# EasyEDA Pro project bliysfyt-night-light-af2cf507.epro, schematic Schematic1

## Sheets
1 P1: Create Date: 2024-02-15; Page Name: P1; Project Name: 夜灯; Schematic Name: Schematic1; Update Date: 2024-02-20; Page Size: A4; Version: V1.0
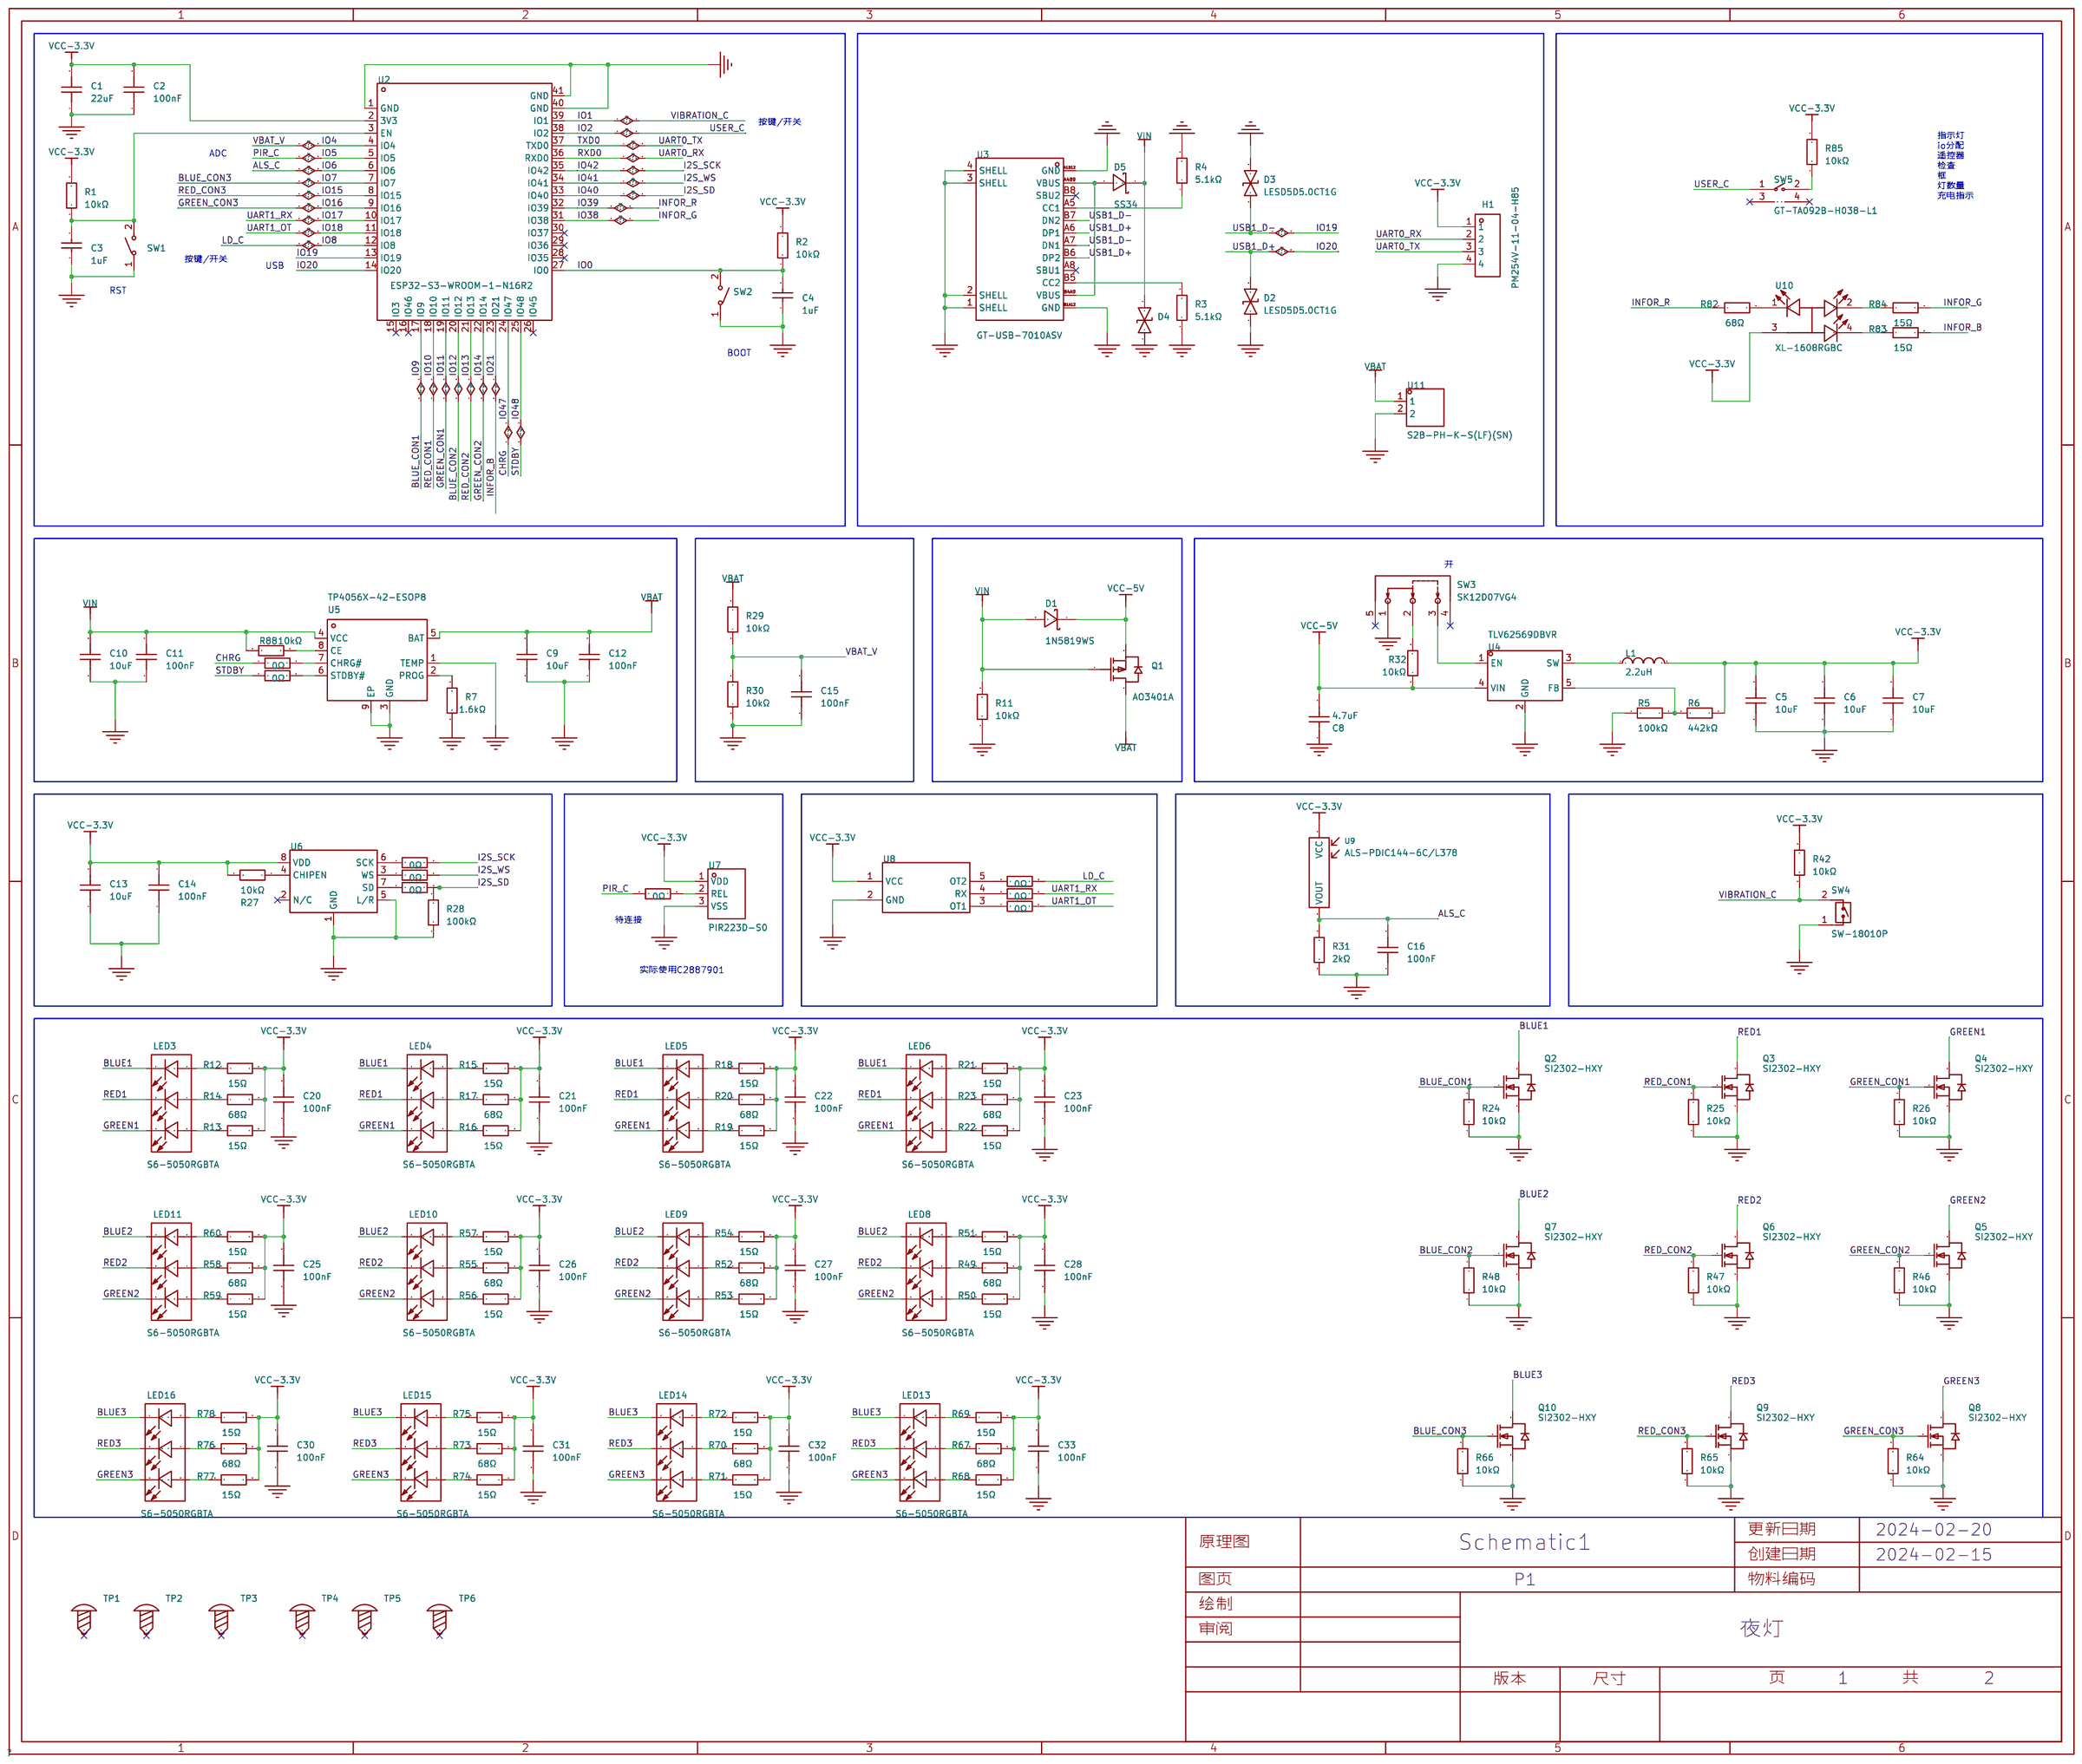
[diagram p0: P1]
2 P2: Create Date: 2024-02-18; Page Name: P2; Update Date: 2024-02-18; Company: 嘉立创EDA
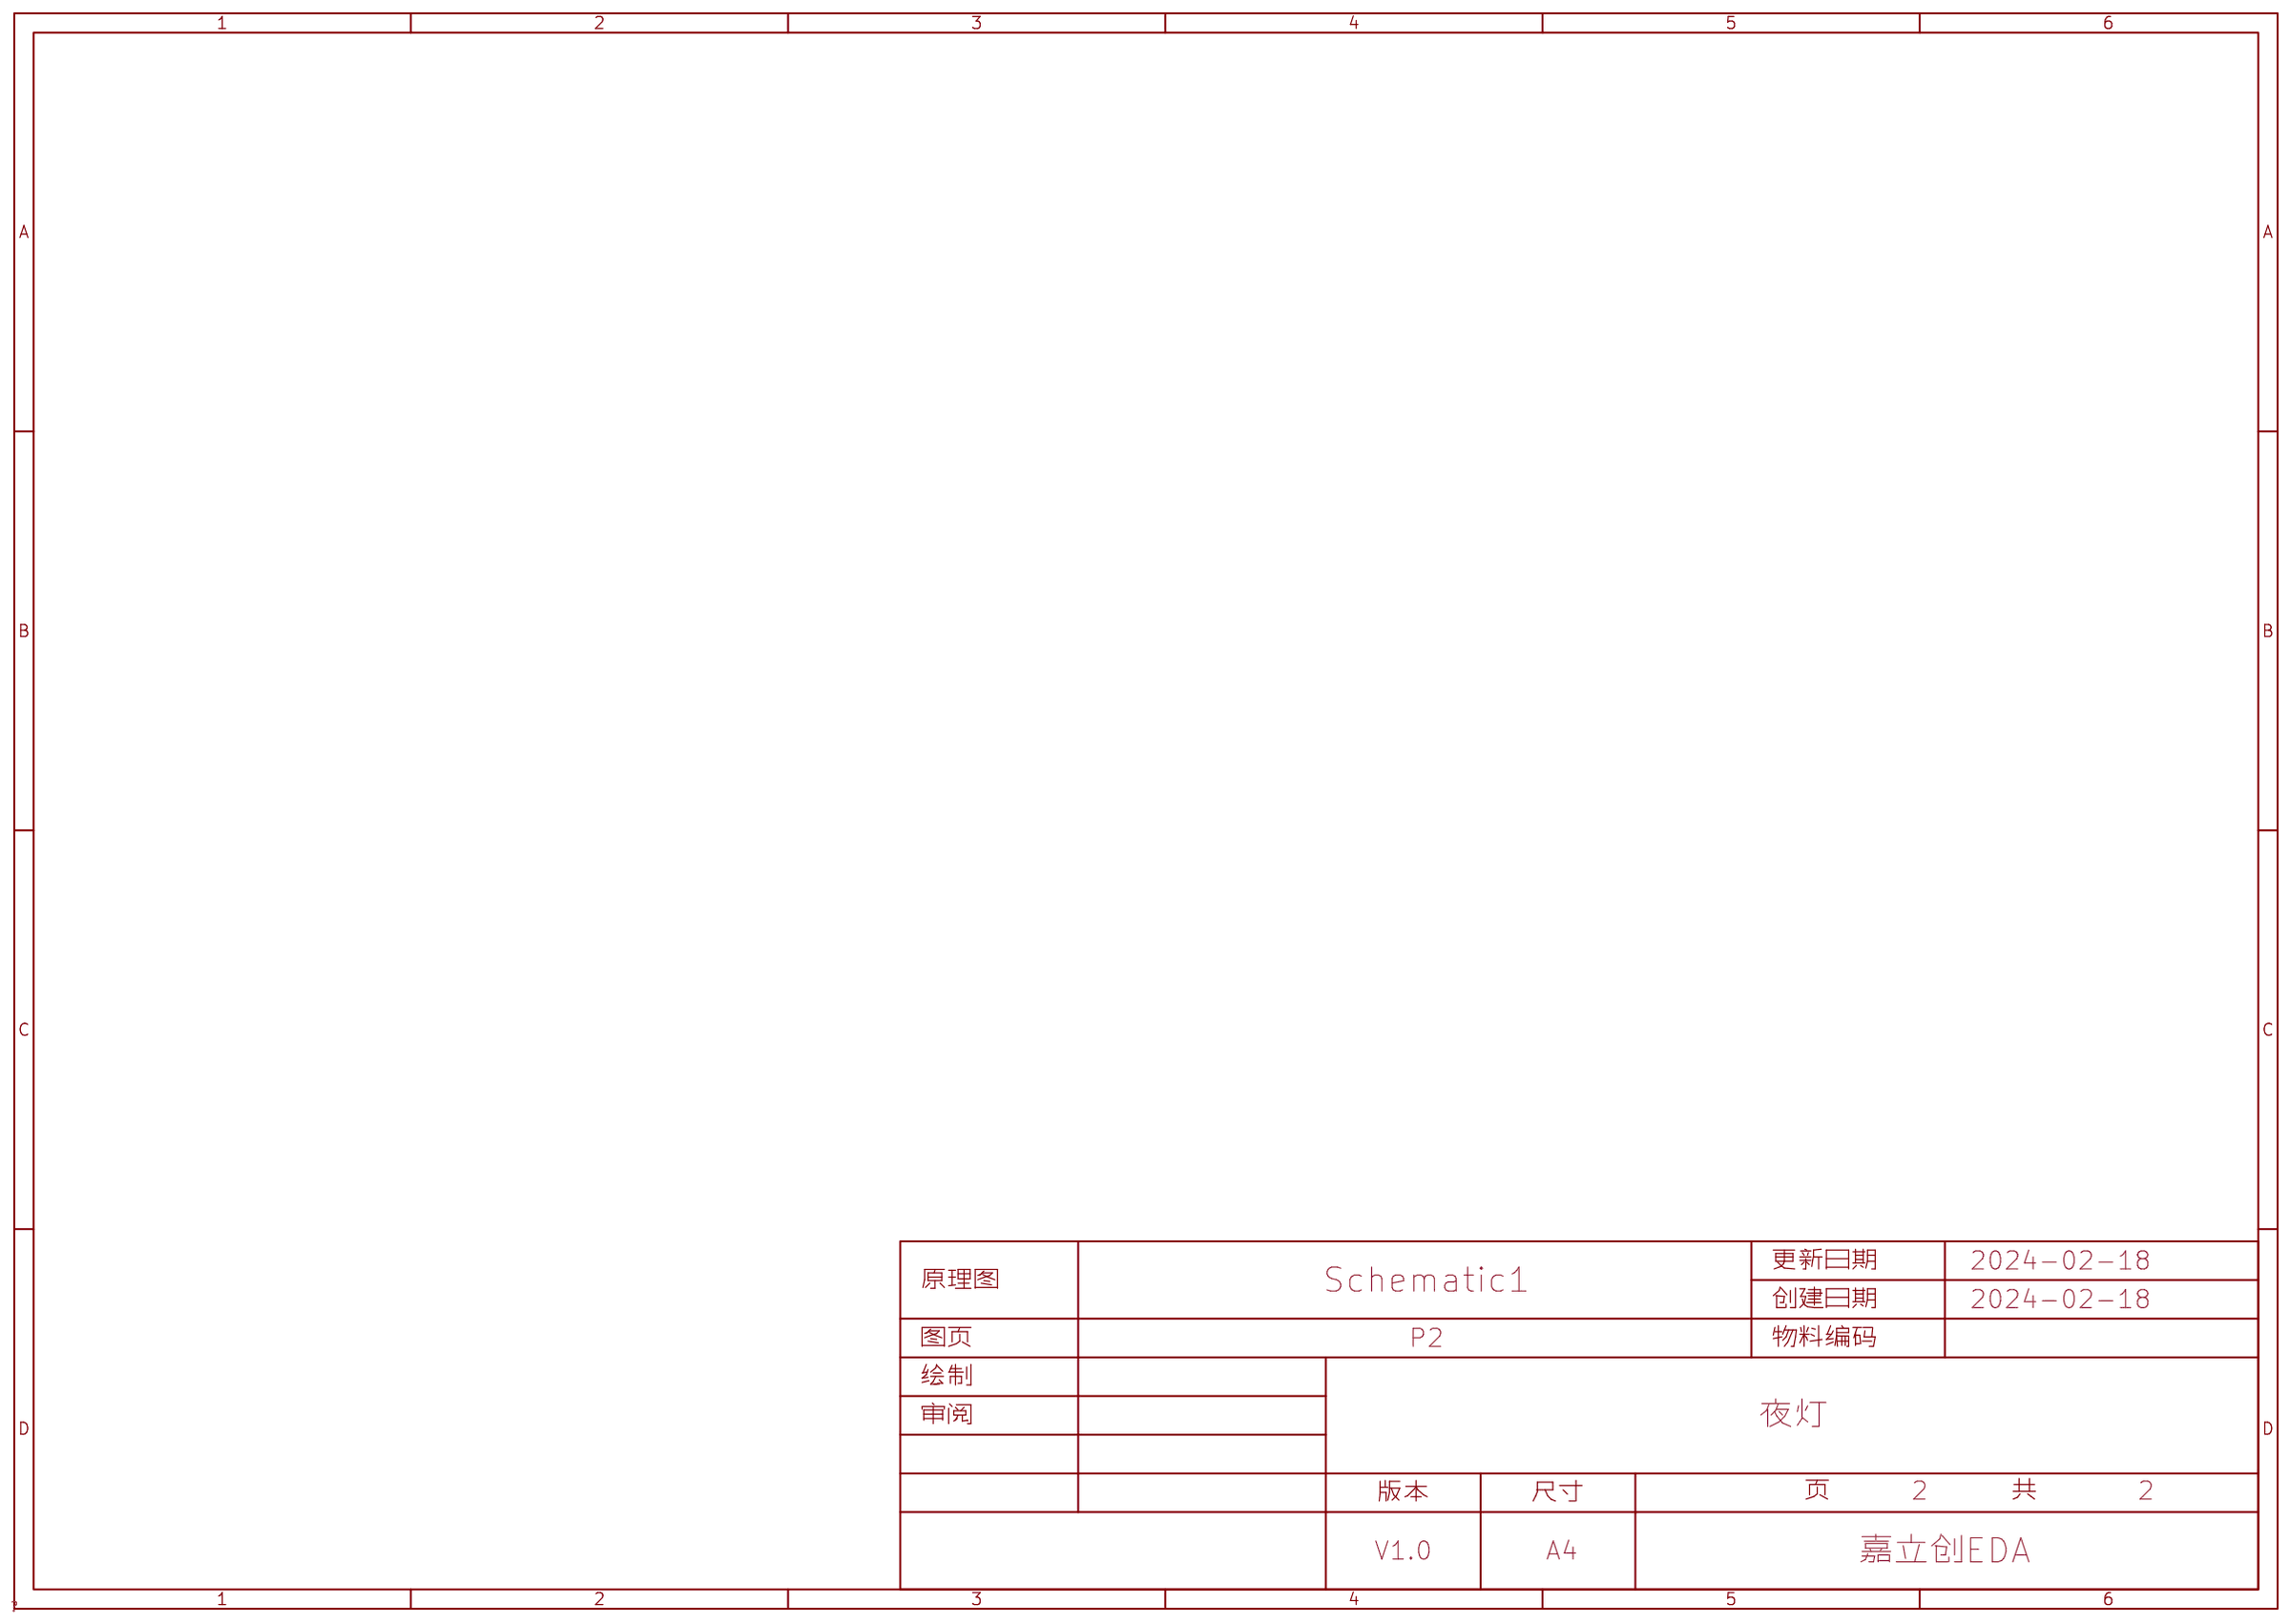
[diagram p1: P2]

## Parts
C1  22uF  [C0603]
C2  100nF  [C0603]
C3  1uF  [C0603]
C4  1uF  [C0603]
C5  10uF  [C0603]
C6  10uF  [C0603]
C7  10uF  [C0603]
C8  4.7uF  [C0603]
C9  10uF  [C0603]
C10  10uF  [C0603]
C11  100nF  [C0603]
C12  100nF  [C0603]
C13  10uF  [C0603]
C14  100nF  [C0603]
C15  100nF  [C0603]
C16  100nF  [C0603]
C20  100nF  [C0603]
C21  100nF  [C0603]
C22  100nF  [C0603]
C23  100nF  [C0603]
C25  100nF  [C0603]
C26  100nF  [C0603]
C27  100nF  [C0603]
C28  100nF  [C0603]
C30  100nF  [C0603]
C31  100nF  [C0603]
C32  100nF  [C0603]
C33  100nF  [C0603]
D1  1N5819WS  [SOD-323_L1.8-W1.3-LS2.5-RD]
D2  LESD5D5.0CT1G  [SOD-523_L1.2-W0.8-LS1.6-BI]
D3  LESD5D5.0CT1G  [SOD-523_L1.2-W0.8-LS1.6-BI]
D4  LESD5D5.0CT1G  [SOD-523_L1.2-W0.8-LS1.6-BI]
D5  SS34  [SMA_L4.3-W2.6-LS5.2-RD]
H1  PM254V-11-04-H85  [HDR-TH_4P-P2.54-V-F]
L1  2.2uH  [IND-SMD_L4.4-W4.2]
LED3  S6-5050RGBTA  [LED-SMD_6P-L5.0-W5.0-P1.60-LS5.4-TL]
LED4  S6-5050RGBTA  [LED-SMD_6P-L5.0-W5.0-P1.60-LS5.4-TL]
LED5  S6-5050RGBTA  [LED-SMD_6P-L5.0-W5.0-P1.60-LS5.4-TL]
LED6  S6-5050RGBTA  [LED-SMD_6P-L5.0-W5.0-P1.60-LS5.4-TL]
LED8  S6-5050RGBTA  [LED-SMD_6P-L5.0-W5.0-P1.60-LS5.4-TL]
LED9  S6-5050RGBTA  [LED-SMD_6P-L5.0-W5.0-P1.60-LS5.4-TL]
LED10  S6-5050RGBTA  [LED-SMD_6P-L5.0-W5.0-P1.60-LS5.4-TL]
LED11  S6-5050RGBTA  [LED-SMD_6P-L5.0-W5.0-P1.60-LS5.4-TL]
LED13  S6-5050RGBTA  [LED-SMD_6P-L5.0-W5.0-P1.60-LS5.4-TL]
LED14  S6-5050RGBTA  [LED-SMD_6P-L5.0-W5.0-P1.60-LS5.4-TL]
LED15  S6-5050RGBTA  [LED-SMD_6P-L5.0-W5.0-P1.60-LS5.4-TL]
LED16  S6-5050RGBTA  [LED-SMD_6P-L5.0-W5.0-P1.60-LS5.4-TL]
Q1  AO3401A  [SOT-23_L2.9-W1.3-P1.90-LS2.4-BR]
Q2  SI2302-HXY  [SOT-23-3_L2.9-W1.3-P1.90-LS2.4-BR]
Q3  SI2302-HXY  [SOT-23-3_L2.9-W1.3-P1.90-LS2.4-BR]
Q4  SI2302-HXY  [SOT-23-3_L2.9-W1.3-P1.90-LS2.4-BR]
Q5  SI2302-HXY  [SOT-23-3_L2.9-W1.3-P1.90-LS2.4-BR]
Q6  SI2302-HXY  [SOT-23-3_L2.9-W1.3-P1.90-LS2.4-BR]
Q7  SI2302-HXY  [SOT-23-3_L2.9-W1.3-P1.90-LS2.4-BR]
Q8  SI2302-HXY  [SOT-23-3_L2.9-W1.3-P1.90-LS2.4-BR]
Q9  SI2302-HXY  [SOT-23-3_L2.9-W1.3-P1.90-LS2.4-BR]
Q10  SI2302-HXY  [SOT-23-3_L2.9-W1.3-P1.90-LS2.4-BR]
R1  10kΩ  [R0603]
R2  10kΩ  [R0603]
R3  5.1kΩ  [R0603]
R4  5.1kΩ  [R0603]
R5  100kΩ  [R0603]
R6  442kΩ  [R0603]
R7  1.6kΩ  [R0603]
R11  10kΩ  [R0603]
R12  15Ω  [R0603]
R13  15Ω  [R0603]
R14  68Ω  [R0603]
R15  15Ω  [R0603]
R16  15Ω  [R0603]
R17  68Ω  [R0603]
R18  15Ω  [R0603]
R19  15Ω  [R0603]
R20  68Ω  [R0603]
R21  15Ω  [R0603]
R22  15Ω  [R0603]
R23  68Ω  [R0603]
R24  10kΩ  [R0603]
R25  10kΩ  [R0603]
R26  10kΩ  [R0603]
R27  10kΩ  [R0603]
R28  100kΩ  [R0603]
R29  10kΩ  [R0603]
R30  10kΩ  [R0603]
R31  2kΩ  [R0603]
R32  10kΩ  [R0603]
R35  0Ω  [R0603]
R36  0Ω  [R0603]
R37  0Ω  [R0603]
R38  0Ω  [R0603]
R39  0Ω  [R0603]
R40  0Ω  [R0603]
R41  0Ω  [R0603]
R42  10kΩ  [R0603]
R46  10kΩ  [R0603]
R47  10kΩ  [R0603]
R48  10kΩ  [R0603]
R49  68Ω  [R0603]
R50  15Ω  [R0603]
R51  15Ω  [R0603]
R52  68Ω  [R0603]
R53  15Ω  [R0603]
R54  15Ω  [R0603]
R55  68Ω  [R0603]
R56  15Ω  [R0603]
R57  15Ω  [R0603]
R58  68Ω  [R0603]
R59  15Ω  [R0603]
R60  15Ω  [R0603]
R64  10kΩ  [R0603]
R65  10kΩ  [R0603]
R66  10kΩ  [R0603]
R67  68Ω  [R0603]
R68  15Ω  [R0603]
R69  15Ω  [R0603]
R70  68Ω  [R0603]
R71  15Ω  [R0603]
R72  15Ω  [R0603]
R73  68Ω  [R0603]
R74  15Ω  [R0603]
R75  15Ω  [R0603]
R76  68Ω  [R0603]
R77  15Ω  [R0603]
R78  15Ω  [R0603]
R82  68Ω  [R0603]
R83  15Ω  [R0603]
R84  15Ω  [R0603]
R85  10kΩ  [R0603]
R86  0Ω  [R0603]
R87  0Ω  [R0603]
R88  10kΩ  [R0603]
SW1  TS-1088R-02026  [SW-SMD_L3.9-W3.0-P4.45]
SW2  TS-1088R-02026  [SW-SMD_L3.9-W3.0-P4.45]
SW3  SK12D07VG4  [SW-TH_SK12D07VG4]
SW4  SW-18010P  [SW-TH_SW-18010P]
SW5  GT-TA092B-H038-L1  [SW-TH_GT-TA092B-H038-L1]
TP1  -  [M3螺丝]
TP2  -  [M3螺丝]
TP3  -  [M3螺丝]
TP4  -  [M3螺丝]
TP5  -  [M3螺丝]
TP6  -  [M3螺丝]
U2  ESP32-S3-WROOM-1-N16R2  [WIRELM-SMD_ESP32-S3-WROOM-1]
U3  GT-USB-7010ASV  [USB-C-SMD_G-SWITCH_GT-USB-7010ASV]
U4  TLV62569DBVR  [SOT-23-5_L3.0-W1.7-P0.95-LS2.8-BR]
U5  TP4056X-42-ESOP8  [SOP-8_L4.9-W3.9-P1.27-LS6.0-TL-EP]
U6  MSM261S4030H0R  [LGA-8_L4.0-W3.0-P1.00-BL]
U7  PIR223D-S0  [TO-5-3_BD9.1-P2.54-L]
U8  -  [HLK-LD2410S/2420封装]
U9  ALS-PDIC144-6C/L378  [SENSORM-TH_EVERLIGHT_ALS-PDIC144-6C--L378]
U10  XL-1608RGBC  [LED-SMD_4P-L1.6-W0.8-BL]
U11  S2B-PH-K-S(LF)(SN)  [CONN-TH_S2B-PH-K-S-LF-SN]

## Library data of the parts
C1 = CL10A226MQ8NRNC: 容值:22uF;精度:±20%;额定电压:6.3V;材质(温度系数):X5R;; LCSC Part Name: 22uF ±20% 6.3V; Supplier Part: C59461; Manufacturer: SAMSUNG(三星); Supplier Footprint: 0603; JLCPCB Part Class: 基础库; Datasheet: https://atta.szlcsc.com/upload/public/pdf/source/20160218/1457707763339.pdf; Supplier: LCSC; Tolerance: ±20%; Voltage Rated: 6.3V; Temperature Coefficient: X5R
C2 C11 C12 C14-C16 C20-C23 C25-C28 C30-C33 = CC0603KRX7R9BB104: 容值:100nF;精度:±10%;额定电压:50V;材质(温度系数):X7R;; LCSC Part Name: 100nF ±10% 50V; Supplier Part: C14663; Manufacturer: YAGEO(国巨); Supplier Footprint: 0603; JLCPCB Part Class: 基础库; Datasheet: https://atta.szlcsc.com/upload/public/pdf/source/20180910/C282072_33301C7F631E79921B82A8DAC6BCC5B3.pdf; Supplier: LCSC; Tolerance: ±10%; Voltage Rated: 50V; Temperature Coefficient: X7R
C3 C4 = CL10A105KB8NNNC: 容值:1uF;精度:±10%;额定电压:50V;材质(温度系数):X5R;; LCSC Part Name: 1uF ±10% 50V; Supplier Part: C15849; Manufacturer: SAMSUNG(三星); Supplier Footprint: 0603; JLCPCB Part Class: Basic Part; Datasheet: https://atta.szlcsc.com/upload/public/pdf/source/20160218/1457707763339.pdf; Supplier: LCSC; Tolerance: ±10%; Voltage Rated: 50V; Temperature Coefficient: X5R
C5-C7 C9 C10 C13 = CL10A106KP8NNNC: 容值:10uF;精度:±10%;额定电压:10V;材质(温度系数):X5R;; LCSC Part Name: 10uF ±10% 10V; Supplier Part: C19702; Manufacturer: SAMSUNG(三星); Supplier Footprint: 0603; JLCPCB Part Class: 基础库; Datasheet: https://atta.szlcsc.com/upload/public/pdf/source/20160218/1457707763339.pdf; Supplier: LCSC; Tolerance: ±10%; Voltage Rated: 10V; Temperature Coefficient: X5R
C8 = GRM188Z71C475KE21D: 容值:4.7uF;精度:±10%;额定电压:16V;材质(温度系数):X7R;; LCSC Part Name: 4.7uF ±10% 16V; Supplier Part: C389010; Manufacturer: muRata(村田); Supplier Footprint: 0603; JLCPCB Part Class: 扩展库; Datasheet: https://atta.szlcsc.com/upload/public/pdf/source/20190418/C389010_378994D96815F6C3A9D8A85630794D48.pdf; Supplier: LCSC; Tolerance: ±10%; Voltage Rated: 16V; Temperature Coefficient: X7R
D1 = 1N5819WS_C191023: 正向压降(Vf):600mV@1A;直流反向耐压(Vr):40V;平均整流电流(Io):1A;; LCSC Part Name: 电压:40V 电流:1A; Supplier Part: C191023; Manufacturer: Hottech(合科泰); Supplier Footprint: SOD-323; JLCPCB Part Class: 基础库; Datasheet: https://atta.szlcsc.com/upload/public/pdf/source/20220428/3CB86FD8D28D653594B4E35F9D5AEFD9.pdf; Supplier: LCSC; Forward Voltage (Vf@If): 600mV@1A; Reverse Voltage (Vr): 40V; Average Rectified Current (Io): 1A
D2-D4 = LESD5D5.0CT1G: 极性:双向;反向截止电压(Vrwm):5V;最大钳位电压:18.6V;峰值脉冲电流(Ipp)@10/1000us:9.4A;击穿电压:5.6V;; LCSC Part Name: 双向ESD; Supplier Part: C383211; Manufacturer: LRC(乐山无线电); Supplier Footprint: SOD-523; JLCPCB Part Class: 扩展库; Datasheet: https://atta.szlcsc.com/upload/public/pdf/source/20190807/C383211_633DF4B4E2C161403226E5235FE33A1C.pdf; Supplier: LCSC; polarity: 双向; Reverse Stand-Off Voltage (Vrwm): 5V; Maximum Clamping Voltage: 18.6V; Peak Pulse Current (Ipp)@10/1000us: 9.4A; Breakdown Voltage: 5.6V; Type: ESD
D5 = SS34_C8678: 二极管配置:独立式;正向压降(Vf):550mV@3A;直流反向耐压(Vr):40V;平均整流电流(Io):3A;; LCSC Part Name: 电压:40V 电流:3A; Supplier Part: C8678; Manufacturer: MDD; Supplier Footprint: SMA(DO-214AC); JLCPCB Part Class: 基础库; Datasheet: https://atta.szlcsc.com/upload/public/pdf/source/20230314/A80AE34493C69B89E2F4B1712F433538.pdf; Supplier: LCSC; Diode Configuration: 独立式; Forward Voltage (Vf@If): 550mV@3A; Reverse Voltage (Vr): 40V; Average Rectified Current (Io): 3A; Reverse Leakage Current (Ir): 500uA@40V
H1 = PM254V-11-04-H85: 插孔结构:1x4P;间距:2.54mm;行距:-;安装类型:直插;排数:单排;总孔位数:4P;塑高:-;触头材质:黄铜;触头镀层:-;; LCSC Part Name: 间距:2.54mm 1x4P 直插; Supplier Part: C541851; Manufacturer: XFCN(兴飞); Supplier Footprint: 插件,P=2.54mm; JLCPCB Part Class: Extended Part; Datasheet: https://atta.szlcsc.com/upload/public/pdf/source/20200518/C541849_85853D71FC67C51915A806977A588FDA.pdf; Supplier: LCSC; Holes Structure: 1x4P; Pitch: 2.54mm; Mounting Type: 直插; Number of Rows: 单排; Number of Holes: 4P; Contact Material: 黄铜
L1 = FXL0420-2R2-M: 电感值:2.2uH;精度:±20%;额定电流:4.5A;饱和电流(Isat):5A;类型:一体成型电感;; LCSC Part Name: 2.2uH ±20% 5A; Supplier Part: C167206; Manufacturer: cjiang(长江微电); Supplier Footprint: SMD,4.2x4.4mm; JLCPCB Part Class: Extended Part; Datasheet: https://atta.szlcsc.com/upload/public/pdf/source/20230516/FBADA9890E7FBE97C620F1D8B562D733.pdf; Supplier: LCSC; Tolerance: ±20%; Rated Current: 4.5A; Saturation Current (Isat): 5A; DC Resistance (DCR): 58mΩ; Type: 一体成型电感
LED3-LED6 LED8-LED11 LED13-LED16 = S6-5050RGBTA: 发光颜色:RGB三色;功率:90mW；60mW;正向电流:20mA;主波长:465nm~470nm；618nm~623nm；518nm~523nm;二极管配置:-;透镜颜色:无色透明透镜;色温:-;发光角度:120°;载带方式:-;工作温度:-40℃~+85℃;; LCSC Part Name: RGB三色; Supplier Part: C2827258; Manufacturer: TUOZHAN(拓展光电); Supplier Footprint: SMD5050; JLCPCB Part Class: 扩展库; Datasheet: https://atta.szlcsc.com/upload/public/pdf/source/20210520/C2827258_40E9C151CEA691D555786A4FF94C5B68.pdf; Supplier: LCSC; Emitted Color: RGB三色; Power Dissipation: 90mW；60mW; Forward Current: 20mA; Dominant Wavelength: 465nm~470nm；618nm~623nm；518nm~523nm; Lens Color: 无色透明透镜; Viewing Angle: 120°; Operating Temperature: -40℃~+85℃
Q1 = AO3401A_C15127: 类型:P沟道;漏源电压(Vdss):30V;连续漏极电流(Id):4A;功率(Pd):1.4W;导通电阻(RDS(on)@Vgs,Id):44mΩ@10V,4.3A;阈值电压(Vgs(th)@Id):1.3V@250uA;; LCSC Part Name: P沟道 耐压:30V 电流:4A; Supplier Part: C15127; Manufacturer: AOS; Supplier Footprint: SOT-23; JLCPCB Part Class: 基础库; Datasheet: https://atta.szlcsc.com/upload/public/pdf/source/20160507/1462613609053.pdf; Supplier: LCSC; Type: P沟道; Drain Source Voltage (Vdss): 30V; Continuous Drain Current (Id): 4A; Power Dissipation (Pd): 1.4W; Drain Source On Resistance (RDS(on)@Vgs,Id): 44mΩ@10V,4.3A; Gate Threshold Voltage (Vgs(th)@Id): 1.3V@250uA; Total Gate Charge (Qg@Vgs): 12.2nC@4.5V; Input Capacitance (Ciss@Vds): 1.2nF@15V; Operating Temperature: -55℃~+150℃@(Tj)
Q2-Q10 = SI2302-HXY: 类型:N沟道;漏源电压(Vdss):20V;连续漏极电流(Id):2.8A;功率(Pd):900mW;导通电阻(RDS(on)@Vgs,Id):55mΩ@4.5V,2.8A;阈值电压(Vgs(th)@Id):1.2V@250uA;; LCSC Part Name: N沟道 耐压:20V 电流:2.8A; Supplier Part: C4748714; Manufacturer: HXY MOSFET(华轩阳电子); Supplier Footprint: SOT-23; JLCPCB Part Class: 扩展库; Datasheet: https://atta.szlcsc.com/upload/public/pdf/source/20220720/B2EC63D46AD65363D9D3692163B46869.pdf; Supplier: LCSC; Type: N沟道; Drain Source Voltage (Vdss): 20V; Continuous Drain Current (Id): 2.8A; Power Dissipation (Pd): 900mW; Drain Source On Resistance (RDS(on)@Vgs,Id): 55mΩ@4.5V,2.8A; Gate Threshold Voltage (Vgs(th)@Id): 1.2V@250uA; Input Capacitance (Ciss@Vds): 260pF@10V
R1 R2 R11 R24-R27 R29 R30 R32 R42 R46-R48 R64-R66 R85 R88 = 0603WAF1002T5E: 电阻类型:厚膜电阻;阻值:10kΩ;精度:±1%;功率:100mW;最大工作电压:75V;温度系数:±100ppm/℃;; LCSC Part Name: 厚膜电阻 10kΩ ±1% 100mW; Supplier Part: C25804; Manufacturer: UNI-ROYAL(厚声); Supplier Footprint: 0603; JLCPCB Part Class: 基础库; Datasheet: https://atta.szlcsc.com/upload/public/pdf/source/20200306/C422600_1E6D84923E4A46A82E41ADD87F860B5C.pdf; Supplier: LCSC; Type: 厚膜电阻; Tolerance: ±1%; Power(Watts): 100mW; Overload Voltage (Max): 75V; Temperature Coefficient: ±100ppm/℃; Operating Temperature Range: -55℃~+155℃
R3 R4 = 0603WAF5101T5E: 电阻类型:厚膜电阻;阻值:5.1kΩ;精度:±1%;功率:100mW;最大工作电压:75V;温度系数:±100ppm/℃;; LCSC Part Name: 5.1kΩ ±1% 100mW 厚膜电阻; Supplier Part: C23186; Manufacturer: UNI-ROYAL(厚声); Supplier Footprint: 0603; JLCPCB Part Class: 基础库; Datasheet: https://atta.szlcsc.com/upload/public/pdf/source/20200306/C422600_1E6D84923E4A46A82E41ADD87F860B5C.pdf; Supplier: LCSC; Type: 厚膜电阻; Tolerance: ±1%; Power(Watts): 100mW; Overload Voltage (Max): 75V; Temperature Coefficient: ±100ppm/℃; Operating Temperature Range: -55℃~+155℃
R5 R28 = 0603WAF1003T5E: 电阻类型:厚膜电阻;阻值:100kΩ;精度:±1%;功率:100mW;最大工作电压:75V;温度系数:±100ppm/℃;; LCSC Part Name: 100kΩ ±1% 100mW 厚膜电阻; Supplier Part: C25803; Manufacturer: UNI-ROYAL(厚声); Supplier Footprint: 0603; JLCPCB Part Class: 基础库; Datasheet: https://atta.szlcsc.com/upload/public/pdf/source/20200306/C422600_1E6D84923E4A46A82E41ADD87F860B5C.pdf; Supplier: LCSC; Type: 厚膜电阻; Tolerance: ±1%; Power(Watts): 100mW; Overload Voltage (Max): 75V; Temperature Coefficient: ±100ppm/℃; Operating Temperature Range: -55℃~+155℃
R6 = 0603WAF4423T5E: 电阻类型:厚膜电阻;阻值:442kΩ;精度:±1%;功率:100mW;最大工作电压:75V;温度系数:±100ppm/℃;; LCSC Part Name: 442kΩ ±1% 100mW 厚膜电阻; Supplier Part: C23175; Manufacturer: UNI-ROYAL(厚声); Supplier Footprint: 0603; JLCPCB Part Class: 扩展库; Datasheet: https://atta.szlcsc.com/upload/public/pdf/source/20200306/C422600_1E6D84923E4A46A82E41ADD87F860B5C.pdf; Supplier: LCSC; Type: 厚膜电阻; Tolerance: ±1%; Power(Watts): 100mW; Overload Voltage (Max): 75V; Temperature Coefficient: ±100ppm/℃; Operating Temperature Range: -55℃~+155℃
R7 = 0603WAF1601T5E: 电阻类型:厚膜电阻;阻值:1.6kΩ;精度:±1%;功率:100mW;最大工作电压:75V;温度系数:±100ppm/℃;; LCSC Part Name: 1.6kΩ ±1% 100mW 厚膜电阻; Supplier Part: C22847; Manufacturer: UNI-ROYAL(厚声); Supplier Footprint: 0603; JLCPCB Part Class: 扩展库; Datasheet: https://atta.szlcsc.com/upload/public/pdf/source/20200306/C422600_1E6D84923E4A46A82E41ADD87F860B5C.pdf; Supplier: LCSC; Type: 厚膜电阻; Tolerance: ±1%; Power(Watts): 100mW; Overload Voltage (Max): 75V; Temperature Coefficient: ±100ppm/℃; Operating Temperature Range: -55℃~+155℃
R12 R13 R15 R16 R18 R19 R21 R22 R50 R51 R53 R54 R56 R57 R59 R60 R68 R69 R71 R72 R74 R75 R77 R78 R83 R84 = 0603WAF150JT5E: 电阻类型:厚膜电阻;阻值:15Ω;精度:±1%;功率:100mW;最大工作电压:75V;温度系数:±100ppm/℃;; LCSC Part Name: 15Ω ±1% 100mW 厚膜电阻; Supplier Part: C22810; Manufacturer: UNI-ROYAL(厚声); Supplier Footprint: 0603; JLCPCB Part Class: Extended Part; Datasheet: https://atta.szlcsc.com/upload/public/pdf/source/20200306/C422600_1E6D84923E4A46A82E41ADD87F860B5C.pdf; Supplier: LCSC; Type: 厚膜电阻; Tolerance: ±1%; Power(Watts): 100mW; Overload Voltage (Max): 75V; Temperature Coefficient: ±100ppm/℃; Operating Temperature Range: -55℃~+155℃
R14 R17 R20 R23 R49 R52 R55 R58 R67 R70 R73 R76 R82 = 0603WAF680JT5E: 电阻类型:厚膜电阻;阻值:68Ω;精度:±1%;功率:100mW;最大工作电压:75V;温度系数:±100ppm/℃;; LCSC Part Name: 68Ω ±1% 100mW 厚膜电阻; Supplier Part: C27592; Manufacturer: UNI-ROYAL(厚声); Supplier Footprint: 0603; JLCPCB Part Class: Extended Part; Datasheet: https://atta.szlcsc.com/upload/public/pdf/source/20200306/C422600_1E6D84923E4A46A82E41ADD87F860B5C.pdf; Supplier: LCSC; Type: 厚膜电阻; Tolerance: ±1%; Power(Watts): 100mW; Overload Voltage (Max): 75V; Temperature Coefficient: ±100ppm/℃; Operating Temperature Range: -55℃~+155℃
R31 = 0603WAF2001T5E: 电阻类型:厚膜电阻;阻值:2kΩ;精度:±1%;功率:100mW;最大工作电压:75V;温度系数:±100ppm/℃;; LCSC Part Name: 2kΩ ±1% 100mW 厚膜电阻; Supplier Part: C22975; Manufacturer: UNI-ROYAL(厚声); Supplier Footprint: 0603; JLCPCB Part Class: 基础库; Datasheet: https://atta.szlcsc.com/upload/public/pdf/source/20200306/C422600_1E6D84923E4A46A82E41ADD87F860B5C.pdf; Supplier: LCSC; Type: 厚膜电阻; Tolerance: ±1%; Power(Watts): 100mW; Overload Voltage (Max): 75V; Temperature Coefficient: ±100ppm/℃; Operating Temperature Range: -55℃~+155℃
R35-R41 R86 R87 = 0603WAF0000T5E: 电阻类型:厚膜电阻;阻值:0Ω;精度:±1%;功率:100mW;最大工作电压:75V;; LCSC Part Name: 0Ω ±1% 100mW 厚膜电阻; Supplier Part: C21189; Manufacturer: UNI-ROYAL(厚声); Supplier Footprint: 0603; JLCPCB Part Class: 基础库; Datasheet: https://atta.szlcsc.com/upload/public/pdf/source/20200306/C422600_1E6D84923E4A46A82E41ADD87F860B5C.pdf; Supplier: LCSC; Type: 厚膜电阻; Tolerance: ±1%; Power(Watts): 100mW; Overload Voltage (Max): 75V; Operating Temperature Range: -55℃~+155℃
SW1 SW2 = TS-1088R-02026: 电路结构:单刀单掷;按钮形状:圆形按钮;安装方式:立贴;开关长度:3.9mm;开关宽度:2.93mm;开关高度:2mm;触点电流:50mA;额定电压(DC):12V;带灯:-;机械寿命:-;; LCSC Part Name: 3.9*2.93*2mm 立贴 轻触开关; Supplier Part: C455280; Manufacturer: XUNPU(讯普); Supplier Footprint: SMD,3x4mm; JLCPCB Part Class: 扩展库; Datasheet: https://atta.szlcsc.com/upload/public/pdf/source/20191118/C455281_EC5379764BC1462550DF64BBBFEA9579.pdf; Supplier: LCSC; Circuit: 单刀单掷; Actuator Style: 圆形按钮; Mounting Style: 立贴; Switch Length: 3.9mm; Switch Width: 2.93mm; Switch Height: 2mm; Contact Current: 50mA; Voltage Rating (DC): 12V
SW3 = SK12D07VG4: 电路结构:单刀双掷;安装方式:侧插;额定电流(DC):500mA;额定电压(DC):50V;额定电流(AC):-;额定电压(AC):-;机械寿命:5千次;; LCSC Part Name: 3脚2档位 卧插 滑动开关; Supplier Part: C393937; Manufacturer: SHOU HAN(首韩); Supplier Footprint: 插件; JLCPCB Part Class: 扩展库; Datasheet: https://atta.szlcsc.com/upload/public/pdf/source/20190521/C393937_939FE26E571CC67D2D532E953108A1B0.pdf; Supplier: LCSC; Circuit: 单刀双掷; Actuator Style: 矩形柱状; Pin Style: PC引脚; Switch Height: 8.8mm; Mounting Style: 侧插; Current Rating (DC): 500mA; Voltage Rating (DC): 50V; Mechanical Life: 5千次
SW4 = SW-18010P: 传感器类型:-;开关寿命:100万次;耐温:-;; LCSC Part Name: 高灵敏震动开关SW-18010P 玩具限位弹簧开关抖动振动开关 黑色直脚; Supplier Part: C2681585; Manufacturer: SHOU HAN(首韩); Supplier Footprint: 插件; JLCPCB Part Class: 扩展库; Datasheet: https://atta.szlcsc.com/upload/public/pdf/source/20210122/C2681585_58E357A0608CE0F21BF5D2CFA19487E4.pdf; Supplier: LCSC; Rated Voltage: 12V; Rated Current: 20mA; Operating Life: 100万次
SW5 = GT-TA092B-H038-L1: 电路结构:单刀单掷;按钮形状:圆形按钮;作用力:250gf;安装方式:侧插;开关长度:4.55mm;开关宽度:5.5mm;开关高度:3.8mm;带支架:带支架;触点电流:50mA;额定电压(DC):12V;绝缘电阻:100MΩ;带灯:无;机械寿命:10万次;; LCSC Part Name: 侧按支架轻触开关 250gf; Supplier Part: C5446825; Manufacturer: G-Switch(品赞); Supplier Footprint: 插件; JLCPCB Part Class: 扩展库; Datasheet: https://atta.szlcsc.com/upload/public/pdf/source/20230412/3626E85470DFCCCE914AFEF8CBA50C0A.pdf; Supplier: LCSC; Circuit: 单刀单掷; Actuator Style: 圆形按钮; Operating Force: 250gf; Mounting Style: 侧插; Switch Length: 4.55mm; Switch Width: 5.5mm; Switch Height: 3.8mm; Strike Gundam: 带支架; Contact Current: 50mA; Voltage Rating (DC): 12V; Insulation Resistance: 100MΩ; Actuator/Cap Color: 黑色; With Lamp: 无; Pin Style: PC引脚; Mechanical Life: 10万次; Operating Temperature: -40℃~+85℃
TP1-TP6 = M3螺丝: Supplier Footprint: 插件
U2 = ESP32-S3-WROOM-1-N16R2: LCSC Part Name: 通用型Wi-Fi+低功耗蓝牙MCU模组; Supplier Part: C2913205; Manufacturer: ESPRESSIF(乐鑫); Supplier Footprint: SMD,18x25.5mm; JLCPCB Part Class: 扩展库; Datasheet: https://atta.szlcsc.com/upload/public/pdf/source/20220628/A2AC12B3C87735CAEB7EBE2DBE80936C.pdf; Supplier: LCSC
U3 = GT-USB-7010ASV: 连接器类型:Type-C;标准:USB 2.0;公母:母;端口数量:1;触点数量:16P;安装方式:卧贴;额定电流 - 电源:3A;触头材质:高导铜;触头镀层:金;工作温度范围:-40℃~+85℃;焊接温度(最大值):-;; LCSC Part Name: Type-C 母 卧贴; Supplier Part: C2988369; Manufacturer: G-Switch(品赞); Supplier Footprint: SMD; JLCPCB Part Class: 扩展库; Datasheet: https://atta.szlcsc.com/upload/public/pdf/source/20230327/DF227B64686AC8FA0AD1775797F2C3F1.pdf; Supplier: LCSC; Connector Type: Type-C; Standard: USB 2.0; Gender: 母; Number of Ports: 1; Number of Contacts: 16P; Mounting Style: 卧贴; Current Rating - Power (Max): 3A; Contact Material: 高导铜; Contact Plating: 金; Operating Temperature Range: -40℃~+85℃
U4 = TLV62569DBVR: 功能类型:降压型;输出类型:可调;输入电压:2.5V~5.5V;输出电压:600mV~5.5V;输出电流(最大值):2A;; Supplier Part: C141836; Manufacturer: TI(德州仪器); Supplier Footprint: SOT-23-5; JLCPCB Part Class: 扩展库; Datasheet: https://www.ti.com/cn/lit/gpn/tlv62569; Supplier: LCSC; Function: 降压型; Output Type: 可调; Input Voltage: 2.5V~5.5V; Output Voltage: 600mV~5.5V; Output Current (Max): 2A; Switching Frequency: 1.5MHz; Operating Temperature: -40℃~+125℃@(TJ); Synchronous Rectification: 是; Topology: 降压式; Switch tube (built-in/external): 内置
U5 = TP4056X-42-ESOP8: Supplier Part: C2763448; Manufacturer: TOPPOWER(南京拓微); Supplier Footprint: SOP-8-EP; JLCPCB Part Class: 扩展库; Datasheet: https://atta.szlcsc.com/upload/public/pdf/source/20221111/3D7D53D5011BF4ED4C4D0D9BFDBB1404.pdf; Supplier: LCSC
U6 = MSM261S4030H0R: Supplier Part: C2840615; Supplier Footprint: LGA-8; JLCPCB Part Class: 扩展库; Datasheet: https://atta.szlcsc.com/upload/public/pdf/source/20210707/C2840615_6AE5BCBEE3224C96A8195D5DC270E7C8.pdf; Supplier: LCSC
U7 = PIR223D-D0: 数字型热释电红外传感器; LCSC Part Name: 热释电红外传感器; Supplier Part: C2887901; Manufacturer: NEWOPTO(鑫永诚光电); Supplier Footprint: TO-5; JLCPCB Part Class: 扩展库; Datasheet: https://atta.szlcsc.com/upload/public/pdf/source/20210910/6A1C1777C852400EB35ECD2F67479D43.pdf; Supplier: LCSC; Check: false
U8 = HLK-LD2420
U9 = ALS-PDIC144-6C/L378: 检测颜色:-;接口类型:-;分辨率(位):-;; Supplier: LCSC; Supplier Part: C2943463; Manufacturer: EVERLIGHT(亿光); JLCPCB Part Class: 扩展库; Supplier Footprint: 插件,D=3mm; Datasheet: https://atta.szlcsc.com/upload/public/pdf/source/20220113/AC450916B5A89D5D56FC0318BB895C2F.pdf; Operating Temperature: -40℃~+85℃
U10 = XL-1608RGBC: 发光颜色:RGB三色;正向电压(VF):1.8V~2.6V；2.8V~3.5V；2.8V~3.5V;功率:55mW；80mW；80mW;正向电流:5mA;主波长:619nm~624nm；527nm~530nm；466nm~469nm;透镜颜色:无色透明透镜;发光强度:150mcd；180mcd；550mcd;发光角度:120°;载带方式:正贴;工作温度:-30℃~+85℃;; Supplier Part: C5349936; Manufacturer: XINGLIGHT(成兴光); Supplier Footprint: 0603; JLCPCB Part Class: 扩展库; Datasheet: https://atta.szlcsc.com/upload/public/pdf/source/20230111/802E3E836AE29513BE1883E19E62DF0E.pdf; Supplier: LCSC; Emitted Color: RGB三色; Forward Voltage (VF): 1.8V~2.6V；2.8V~3.5V；2.8V~3.5V; Power Dissipation: 55mW；80mW；80mW; Forward Current: 5mA; Dominant Wavelength: 619nm~624nm；527nm~530nm；466nm~469nm; Peak Wavelength: 470nm；630nm；630nm; Lens Color: 无色透明透镜; Luminous Intensity: 150mcd；180mcd；550mcd; Viewing Angle: 120°; Mounting Sytle: 正贴; Operating Temperature: -30℃~+85℃
U11 = S2B-PH-K-S(LF)(SN): 插针结构:1x2P;间距:2mm;安装方式:弯插;参考系列:PH;总PIN数:2P;排数:1;每排PIN数:2;行距:-;触头材质:黄铜;; LCSC Part Name: 系列:PH 间距:2mm 1x2P; Supplier Part: C173752; Manufacturer: JST; Supplier Footprint: 弯插,P=2mm; JLCPCB Part Class: 扩展库; Datasheet: https://atta.szlcsc.com/upload/public/pdf/source/20181010/C265101_22107ACC4D8714694FDA2DD97145FA81.pdf; Supplier: LCSC; Pins Structure: 1x2P; Pitch: 2mm; Mounting Style: 弯插; Reference Series: PH; Number of Pins: 2P; Number of Rows: 1; Number of PINs Per Row: 2; Contact Material: 黄铜

## Nets
GND: C1.1 C2.1 C3.1 C4.1 C5.1 C6.1 C7.1 C8.1 C9.1 C10.1 C11.1 C12.1 C13.1 C14.1 C15.1 C16.1 C20.1 C21.1 C22.1 C23.1 C25.1 C26.1 C27.1 C28.1 C30.1 C31.1 C32.1 C33.1 D2.1 D3.2 D4.1 H1.4 Q2.2(S) Q3.2(S) Q4.2(S) Q5.2(S) Q6.2(S) Q7.2(S) Q8.2(S) Q9.2(S) Q10.2(S) R3.1 R4.2 R5.1 R7.1 R11.1 R24.1 R25.1 R26.1 R28.1 R30.1 R31.1 R46.1 R47.1 R48.1 R64.1 R65.1 R66.1 SW1.1 SW2.1 SW3.1 SW4.1 U2.1(GND) U2.40(GND) U2.41(GND) U3.1(SHELL) U3.2(SHELL) U3.3(SHELL) U3.4(SHELL) U3.A1B12(GND) U3.B1A12(GND) U4.2(GND) U5.1(TEMP) U5.3(GND) U5.9(EP) U6.1(GND) U6.5(L/R) U7.3(VSS) U8.2(GND) U11.2
VBAT: C9.2 C12.2 Q1.3(D) R29.2 U5.5(BAT) U11.1
VCC-3.3V: C1.2 C2.2 C5.2 C6.2 C7.2 C13.2 C14.2 C20.2 C21.2 C22.2 C23.2 C25.2 C26.2 C27.2 C28.2 C30.2 C31.2 C32.2 C33.2 H1.1 L1.2 R1.2 R2.2 R6.1 R12.2 R13.2 R14.2 R15.2 R16.2 R17.2 R18.2 R19.2 R20.2 R21.2 R22.2 R23.2 R27.2 R42.2 R49.2 R50.2 R51.2 R52.2 R53.2 R54.2 R55.2 R56.2 R57.2 R58.2 R59.2 R60.2 R67.2 R68.2 R69.2 R70.2 R71.2 R72.2 R73.2 R74.2 R75.2 R76.2 R77.2 R78.2 R85.2 U2.2(3V3) U6.8(VDD) U7.1(VDD) U8.1(VCC) U9.1(VCC) U10.3(com)
VCC-5V: C8.2 D1.1(K) Q1.2(S) R32.1 U4.4(VIN)
VIN: C10.2 C11.2 D1.2(A) D4.2 D5.1(K) Q1.1(G) R11.2 R88.2 U5.4(VCC)
ALS_C: C16.2 R31.2 U2.6(IO6) U9.2(VOUT)
BLUE1: LED3.1 LED4.1 LED5.1 LED6.1 Q2.3(D)
BLUE2: LED8.1 LED9.1 LED10.1 LED11.1 Q7.3(D)
BLUE3: LED13.1 LED14.1 LED15.1 LED16.1 Q10.3(D)
BLUE_CON1: Q2.1(G) R24.2 U2.17(IO9)
BLUE_CON2: Q7.1(G) R48.2 U2.20(IO12)
BLUE_CON3: Q10.1(G) R66.2 U2.7(IO7)
CHRG: R86.1 U2.24(IO47)
GREEN1: LED3.5 LED4.5 LED5.5 LED6.5 Q4.3(D)
GREEN2: LED8.5 LED9.5 LED10.5 LED11.5 Q5.3(D)
GREEN3: LED13.5 LED14.5 LED15.5 LED16.5 Q8.3(D)
GREEN_CON1: Q4.1(G) R26.2 U2.19(IO11)
GREEN_CON2: Q5.1(G) R46.2 U2.22(IO14)
GREEN_CON3: Q8.1(G) R64.2 U2.9(IO16)
I2S_SCK: R35.2 U2.35(IO42)
I2S_SD: R28.2 R37.2 U2.33(IO40)
I2S_WS: R36.2 U2.34(IO41)
INFOR_B: R83.2 U2.23(IO21)
INFOR_G: R84.2 U2.31(IO38)
INFOR_R: R82.1 U2.32(IO39)
IO0: C4.2 R2.1 SW2.2 U2.27(IO0)
IO1: R42.1 SW4.2 U2.39(IO1)
IO2: SW5.1 U2.38(IO2)
IO4: C15.2 R29.1 R30.2 U2.4(IO4)
IO5: R38.1 U2.5(IO5)
IO8: R39.2 U2.12(IO8)
IO10: Q3.1(G) R25.2 U2.18(IO10)
IO13: Q6.1(G) R47.2 U2.21(IO13)
IO15: Q9.1(G) R65.2 U2.8(IO15)
IO17: R40.2 U2.10(IO17)
IO18: R41.2 U2.11(IO18)
IO19: D3.1 U2.13(IO19) U3.A7(DN1) U3.B7(DN2)
IO20: D2.2 U2.14(IO20) U3.A6(DP1) U3.B6(DP2)
IO48: R87.1 U2.25(IO48)
RED1: LED3.3 LED4.3 LED5.3 LED6.3 Q3.3(D)
RED2: LED8.3 LED9.3 LED10.3 LED11.3 Q6.3(D)
RED3: LED13.3 LED14.3 LED15.3 LED16.3 Q9.3(D)
RXD0: H1.2 U2.36(RXD0)
TXD0: H1.3 U2.37(TXD0)
$1N1581: C3.2 R1.1 SW1.2 U2.3(EN)
$1N2497: R4.1 U3.A5(CC1)
$1N2508: R3.2 U3.B5(CC2)
$1N3854: L1.1 U4.3(SW)
$1N3890: R5.2 R6.2 U4.5(FB)
$1N5011: R7.2 U5.2(PROG)
$1N7236: LED3.2 R12.1
$1N7239: LED3.4 R14.1
$1N7242: LED3.6 R13.1
$1N7496: LED4.2 R15.1
$1N7498: LED4.4 R17.1
$1N7500: LED4.6 R16.1
$1N7689: LED5.2 R18.1
$1N7691: LED5.4 R20.1
$1N7693: LED5.6 R19.1
$1N7882: LED6.2 R21.1
$1N7884: LED6.4 R23.1
$1N7886: LED6.6 R22.1
$1N8648: R27.1 U6.4(CHIPEN)
$1N15540: SW3.3 U4.1(EN)
$1N17583: R32.2 SW3.2
$1N22825: R35.1 U6.6(SCK)
$1N22877: R36.1 U6.3(WS)
$1N23012: R37.1 U6.7(SD)
$1N23226: R38.2 U7.2(REL)
$1N23307: R39.1 U8.5(OT2)
$1N23351: R40.1 U8.4(RX)
$1N23395: R41.1 U8.3(OT1)
$1N26207: LED8.6 R50.1
$1N26208: LED8.4 R49.1
$1N26209: LED8.2 R51.1
$1N26222: LED9.6 R53.1
$1N26223: LED9.4 R52.1
$1N26224: LED9.2 R54.1
$1N26231: LED10.6 R56.1
$1N26232: LED10.4 R55.1
$1N26233: LED10.2 R57.1
$1N26246: LED11.6 R59.1
$1N26247: LED11.4 R58.1
$1N26248: LED11.2 R60.1
$1N65495: LED13.6 R68.1
$1N65496: LED13.4 R67.1
$1N65497: LED13.2 R69.1
$1N65505: LED14.6 R71.1
$1N65506: LED14.4 R70.1
$1N65507: LED14.2 R72.1
$1N65514: LED15.6 R74.1
$1N65515: LED15.4 R73.1
$1N65516: LED15.2 R75.1
$1N65524: LED16.6 R77.1
$1N65525: LED16.4 R76.1
$1N65526: LED16.2 R78.1
$1N67187: R82.2 U10.1
$1N67189: R84.1 U10.2
$1N67191: R83.1 U10.4
$1N67359: R85.1 SW5.2
$1N68623: R86.2 U5.7(CHRG#)
$1N68667: R87.2 U5.6(STDBY#)
$1N73747: R88.1 U5.8(CE)
$1N77958: D5.2(A) U3.A4B9(VBUS) U3.B4A9(VBUS)

Not connected (* = marked no-connect by the designer): SW3 4* 5*; SW5 3* 4*; TP1 1*; TP2 1*; TP3 1*; TP4 1*; TP5 1*; TP6 1*; U2 15(IO3)* 16(IO46)* 26(IO45)* 28(IO35)* 29(IO36)* 30(IO37)*; U3 A8(SBU1)* B8(SBU2)*; U6 2(N/C)*

## Notes on the sheets
sheet 1
- 按键/开关
- 指示灯
  io分配
  遥控器
  检查
  框
  灯数量
  充电指示
- ADC
- 按键/开关
- USB
- RST
- BOOT
- 开
- 待连接
- 实际使用C2887901
